# Altium schematic sheet FK.SchDoc: ИЛ1396ТО1/1
size 410 x 297 mm; ApprovedBy: Стерхов В.Д.; CheckedBy: Стерхов В.Д.; Author: Сергеев Д.А.; CompanyName: ГК "СНАБЖЕНИЕ"; DrawnBy: Сергеев Д.А.; Engineer: Сергеев Д.А.; Organization: ГК "СНАБЖЕНИЕ"; DocumentNumber: ИЛ1396ТО1/1; Revision: 1; SheetNumber: 2; SheetTotal: 2
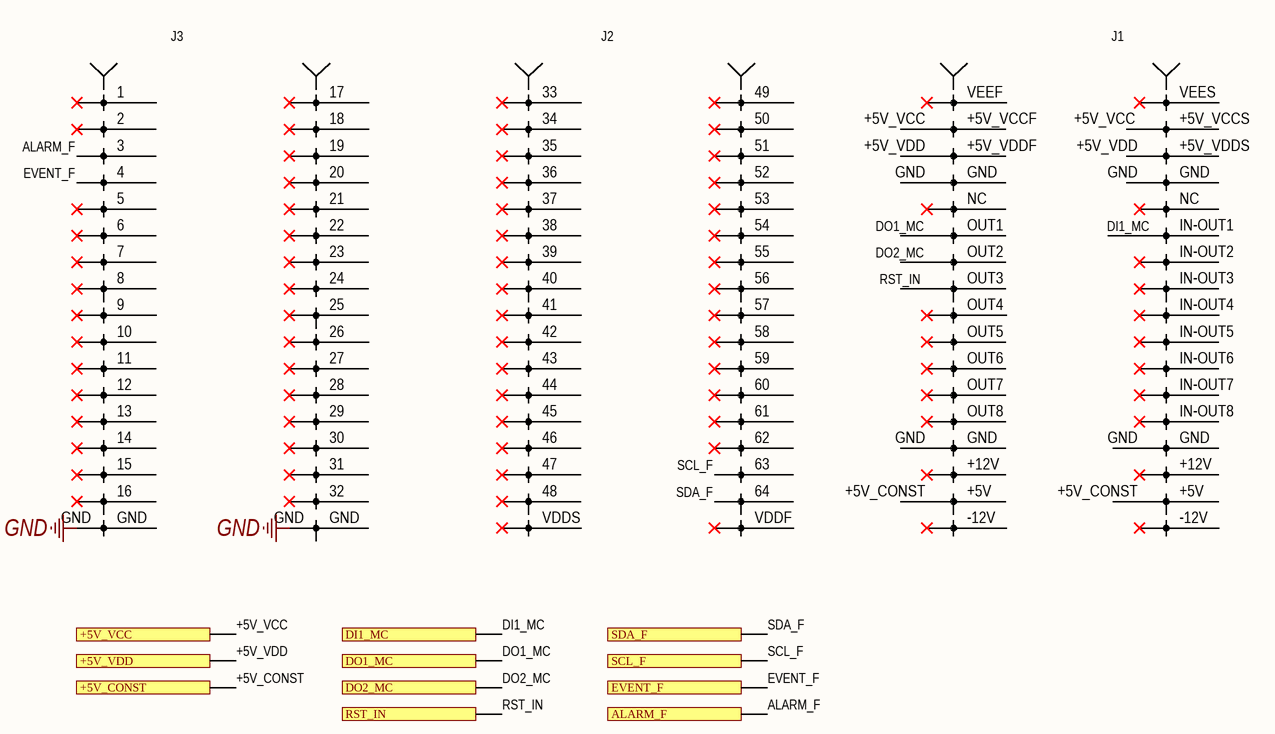
[diagram p0: FK.SchDoc]

## Parts
X1  FORMULA  [FORMULA]  (value not drawn)

## Ports
+5V_CONST, +5V_VCC, +5V_VDD, ALARM_F, DI1_MC, DO1_MC, DO2_MC, EVENT_F, RST_IN, SCL_F, SDA_F

## Nets
GND: X1.GND
+5V_CONST: X1.+5V ; port +5V_CONST
+5V_VCC: X1.+5V_VCCF(VCCF) X1.+5V_VCCS(VCCS) ; port +5V_VCC
+5V_VDD: X1.+5V_VDDF(VDDF) X1.+5V_VDDS(VDDS) ; port +5V_VDD
ALARM_F: X1.3 ; port ALARM_F
DI1_MC: X1.IN-OUT1 ; port DI1_MC
DO1_MC: X1.OUT1 ; port DO1_MC
DO2_MC: X1.OUT2 ; port DO2_MC
EVENT_F: X1.4 ; port EVENT_F
RST_IN: X1.OUT3 ; port RST_IN
SCL_F: X1.63 ; port SCL_F
SDA_F: X1.64 ; port SDA_F

Not connected (* = marked no-connect by the designer): X1 1* 2* 5* 6* 7* 8* 9* 10* 11* 12* 13* 14* 15* 16* 17* 18* 19* 20* 21* 22* 23* 24* 25* 26* 27* 28* 29* 30* 31* 32* 33* 34* 35* 36(4)* 37(5)* 38* 39* 40* 41* 42* 43* 44* 45* 46* 47* 48* 49* 50* 51* 52* 53* 54* 55* 56* 57* 58* 59* 60* 61* 62* +12V* -12V* IN-OUT2* IN-OUT3* IN-OUT4* IN-OUT5* IN-OUT6* IN-OUT7* IN-OUT8* NC* OUT4* OUT5* OUT6* OUT7* OUT8* VDDF* VDDS* VEEF* VEES*

## Notes on the sheet
- Перв. примен.
- Справ. №
- Подп. и дата
- Инв. № дубл.
- Взам. инв. №
- Разраб.
- Изм.
- Лист
- № докум.
- Подп.
- Дата
- Литера
- Масса
- Масштаб
- Пров.
- Т.контр.
- Листов
- Инв. № подл.
- Н.контр.
- Утв.
- Форма 1 ГОСТ 2.104-2006
- Копировал
- Формат А3
- (in symbol FORMULA) J3; J2; J1